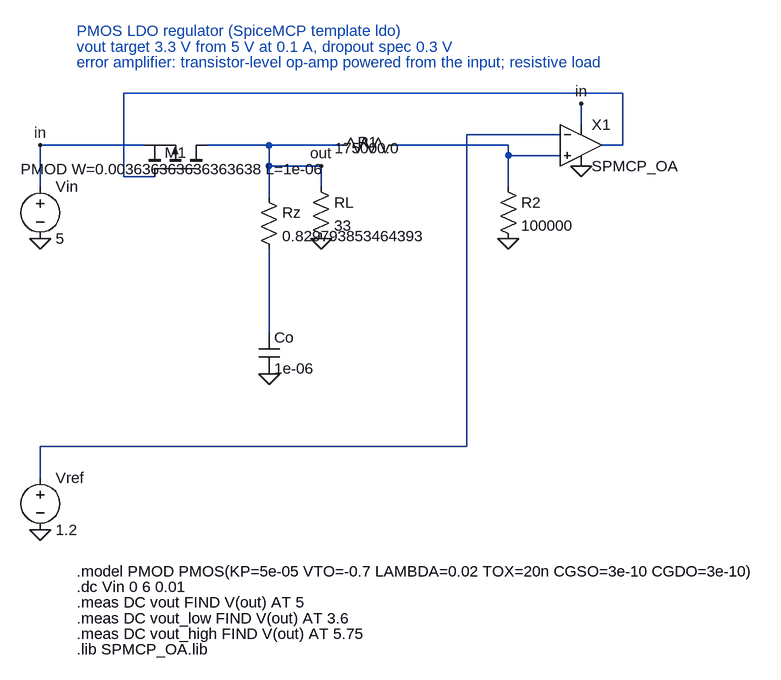
[diagram p0: schematic ldo.asc]
ldo.asc, the LTspice schematic file:
Version 4.1
SHEET 1 1600 1200
WIRE 288 288 288 160
WIRE 96 0 -64 0
WIRE -64 0 -64 64
WIRE 768 -32 768 -64
WIRE 288 80 288 32
WIRE 288 32 288 0
WIRE 288 0 192 0
WIRE 368 64 368 32
WIRE 368 32 288 32
WIRE 400 0 288 0
WIRE 656 64 656 16
WIRE 656 16 656 0
WIRE 656 0 480 0
WIRE 736 16 656 16
WIRE 800 0 832 0
WIRE 832 0 832 -80
WIRE 832 -80 64 -80
WIRE 64 -80 64 48
WIRE 64 48 112 48
WIRE 736 -16 592 -16
WIRE 592 -16 592 464
WIRE 592 464 -64 464
WIRE -64 464 -64 512
FLAG 368 32 out
FLAG -64 0 in
FLAG 768 -64 in
FLAG -64 144 0
FLAG -64 592 0
FLAG 768 32 0
FLAG 656 144 0
FLAG 368 144 0
FLAG 288 352 0
SYMBOL OpAmps\\opamp2 768 -64 R0
SYMATTR InstName X1
SYMATTR Value SPMCP_OA
SYMBOL pmos 192 48 M270
WINDOW 0 52 48 VBottom 2
WINDOW 3 -4 48 VTop 2
SYMATTR InstName M1
SYMATTR Value PMOD W=0.003636363636363638 L=1e-06
SYMBOL res 384 16 R270
WINDOW 0 36 56 VBottom 2
WINDOW 3 -4 56 VTop 2
SYMATTR InstName R1
SYMATTR Value 175000.0
SYMBOL res 272 64 R0
SYMATTR InstName Rz
SYMATTR Value 0.829793853464393
SYMBOL cap 272 288 R0
SYMATTR InstName Co
SYMATTR Value 1e-06
SYMBOL res 640 48 R0
SYMATTR InstName R2
SYMATTR Value 100000
SYMBOL res 352 48 R0
SYMATTR InstName RL
SYMATTR Value 33
SYMBOL voltage -64 48 R0
SYMATTR InstName Vin
SYMATTR Value 5
SYMBOL voltage -64 496 R0
SYMATTR InstName Vref
SYMATTR Value 1.2
TEXT -8 -176 Left 2 ;PMOS LDO regulator (SpiceMCP template ldo)
TEXT -8 -152 Left 2 ;vout target 3.3 V from 5 V at 0.1 A, dropout spec 0.3 V
TEXT -8 -128 Left 2 ;error amplifier: transistor-level op-amp powered from the input; resistive load
TEXT -8 656 Left 2 !.model PMOD PMOS(KP=5e-05 VTO=-0.7 LAMBDA=0.02 TOX=20n CGSO=3e-10 CGDO=3e-10)
TEXT -8 680 Left 2 !.dc Vin 0 6 0.01
TEXT -8 704 Left 2 !.meas DC vout FIND V(out) AT 5
TEXT -8 728 Left 2 !.meas DC vout_low FIND V(out) AT 3.6
TEXT -8 752 Left 2 !.meas DC vout_high FIND V(out) AT 5.75
TEXT -8 776 Left 2 !.lib SPMCP_OA.lib

The netlist it stands for:
* ldo.asc
X§X1 N002 N004 in 0 N003 SPMCP_OA  ; pins In+ In- V+ V- OUT
M1 out N003 in in PMOD W=0.003636363636363638 L=1e-06
R1 out N002 175000.0
Rz out N001 0.829793853464393
Co N001 0 1e-06
R2 N002 0 100000
RL out 0 33
Vin in 0 5
Vref N004 0 1.2
.model NMOS NMOS
.model PMOS PMOS
.lib standard.mos
* PMOS LDO regulator (SpiceMCP template ldo)
* vout target 3.3 V from 5 V at 0.1 A, dropout spec 0.3 V
* error amplifier: transistor-level op-amp powered from the input; resistive load
.model PMOD PMOS(KP=5e-05 VTO=-0.7 LAMBDA=0.02 TOX=20n CGSO=3e-10 CGDO=3e-10)
.dc Vin 0 6 0.01
.meas DC vout FIND V(out) AT 5
.meas DC vout_low FIND V(out) AT 3.6
.meas DC vout_high FIND V(out) AT 5.75
.lib SPMCP_OA.lib
.backanno
.end